# Altium schematic sheet 11_LEDS.SchDoc: Схема электрическая принципиальная
size 420 x 297 mm; ApprovedBy: Скрябин; CheckedBy: Скрябин; Author: Корсунов; CompanyName: РТУ МИРЭА; SheetNumber: 11; SheetTotal: 11; PageSetup: Record=PageOptions|CenterHorizontal=True|CenterVertical=True|PrintScale=0.94|XCorrection=1.00|YCorrection=1.00|PrintKind=1|BorderSize=5000000|LeftOffset=0|BottomOffset=0|Orientation=1|PaperLength=1000|PaperWidth=1000|Scale=100|PaperSource=7|PrintQuality=-4|MediaType=1|DitherType=10|PaperKind=A4|PrintScaleMode=1; DecimalNumber: RP23.000001.011 Э3; Name1: Модуль ввода-вывода; lit_A: О; Name2: RP2350 OPC UA
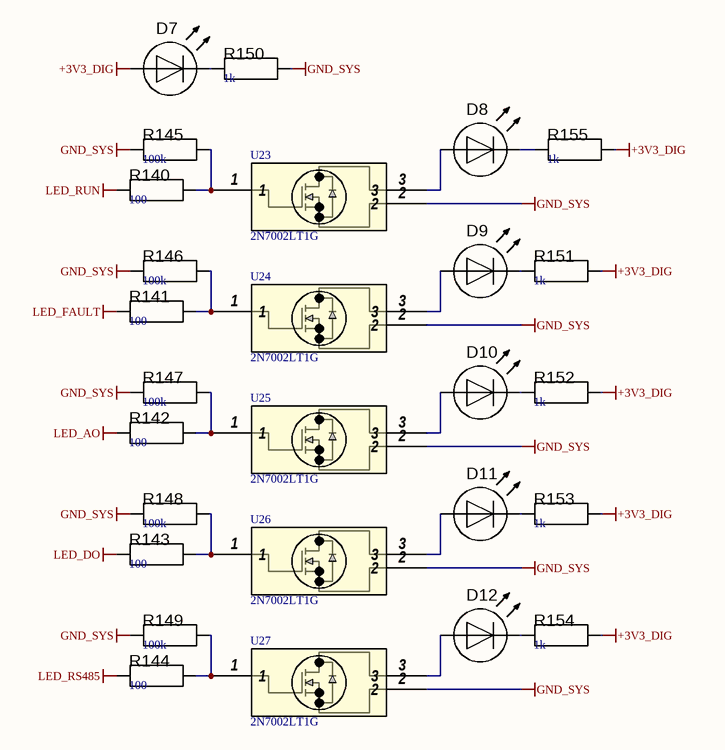
[diagram p0: 11_LEDS.SchDoc]

## Parts
D7  Light-Emitting Diode  [LED_PLCC2_3528]  (value not drawn)
D8  Light-Emitting Diode  [LED_PLCC2_3528]  (value not drawn)
D9  Light-Emitting Diode  [LED_PLCC2_3528]  (value not drawn)
D10  Light-Emitting Diode  [LED_PLCC2_3528]  (value not drawn)
D11  Light-Emitting Diode  [LED_PLCC2_3528]  (value not drawn)
D12  Light-Emitting Diode  [LED_PLCC2_3528]  (value not drawn)
R140  value 100  [R_0603]  (hidden comment: Resistor)
R141  value 100  [R_0603]  (hidden comment: Resistor)
R142  value 100  [R_0603]  (hidden comment: Resistor)
R143  value 100  [R_0603]  (hidden comment: Resistor)
R144  value 100  [R_0603]  (hidden comment: Resistor)
R145  value 100k  [R_0603]  (hidden comment: Resistor)
R146  value 100k  [R_0603]  (hidden comment: Resistor)
R147  value 100k  [R_0603]  (hidden comment: Resistor)
R148  value 100k  [R_0603]  (hidden comment: Resistor)
R149  value 100k  [R_0603]  (hidden comment: Resistor)
R150  value 1k  [R_0603]  (hidden comment: Resistor)
R151  value 1k  [R_0603]  (hidden comment: Resistor)
R152  value 1k  [R_0603]  (hidden comment: Resistor)
R153  value 1k  [R_0603]  (hidden comment: Resistor)
R154  value 1k  [R_0603]  (hidden comment: Resistor)
R155  value 1k  [R_0603]  (hidden comment: Resistor)
U23  2N7002LT1G  [SOT-23_3L_ONS]
U24  2N7002LT1G  [SOT-23_3L_ONS]
U25  2N7002LT1G  [SOT-23_3L_ONS]
U26  2N7002LT1G  [SOT-23_3L_ONS]
U27  2N7002LT1G  [SOT-23_3L_ONS]

## Nets
+3V3_DIG: D7.1(A) R151.2 R152.2 R153.2 R154.2 R155.2
GND_SYS: R145.1 R146.1 R147.1 R148.1 R149.1 R150.2 U23.2 U24.2 U25.2 U26.2 U27.2
LED_AO: R142.1
LED_DO: R143.1
LED_FAULT: R141.1
LED_RS485: R144.1
LED_RUN: R140.1
NetD7_2: D7.2(C) R150.1
NetD8_1: D8.1(A) U23.3
NetD8_2: D8.2(C) R155.1
NetD9_1: D9.1(A) U24.3
NetD9_2: D9.2(C) R151.1
NetD10_1: D10.1(A) U25.3
NetD10_2: D10.2(C) R152.1
NetD11_1: D11.1(A) U26.3
NetD11_2: D11.2(C) R153.1
NetD12_1: D12.1(A) U27.3
NetD12_2: D12.2(C) R154.1
NetR140_2: R140.2 R145.2 U23.1
NetR141_2: R141.2 R146.2 U24.1
NetR142_2: R142.2 R147.2 U25.1
NetR143_2: R143.2 R148.2 U26.1
NetR144_2: R144.2 R149.2 U27.1

## Notes on the sheet
- Перв.примен.
- Справ.№
- Подп. и дата
- Инв.№ дубл.
- Взам.инв.№
- Подп.и дата
- Разраб.
- Изм.
- Лист
- № докум.
- Подп.
- Дата
- Лит.
- Масштаб
- Масса
- Т.контр.
- Пров.
- СХЕМА   ЭЛЕКТРИЧЕСКАЯ
- ПРИНЦИПИАЛЬНАЯ
- Листов
- Инв.№ подл.
- Утв.
- Н.контр.
- Нач.сект.
- Формат  A3

## Library data of the parts
D7-D12 = LED: AF: 1; BV: 0; BV_MAX: 1e99; EG: 1.11; FC: 0.5; IBV: 0.001; IS: 1e-14; MJSW: 0.33; NTUN: 30; TNOM: 27; XTI: 3; SimulationGenericComponent: True; CJO: 0; CJP: 0; CTA: 0; CTP: 0; FCS: 0.5; FV_MAX: 1e99; IKF: 0; IKR: 0; ISR: 1e-14; JSW: 0; JTUN: 0; JTUNSW: 0; KEG: 1; KF: 0; LEVEL: 1; N: 1; NBV: 1; NR: 1; NS: 1; PHP: 1; RS: 0; TCV: 0; TLEV: 0; TLEVC: 0; TM1: 0; TM2: 0; TPB: 0; TPHP: 0; TRS: 0; TRS2: 0; TT: 0; TTT1: 0; TTT2: 0; VJ: 1; XTITUN: 3
R140-R155 = Resistor: TC1: 0; SimulationGenericComponent: True; TC2: 0
U23-U27 = 2N7002LT1G: Description; Manufacturer_Name: onsemi; Copyright: Copyright (C) 2026 Ultra Librarian. All rights reserved.; Manufacturer_Part_Number: 2N7002LT1G; RefDes: RefDes; Type: Type